# Altium project flyback.PrjPcb
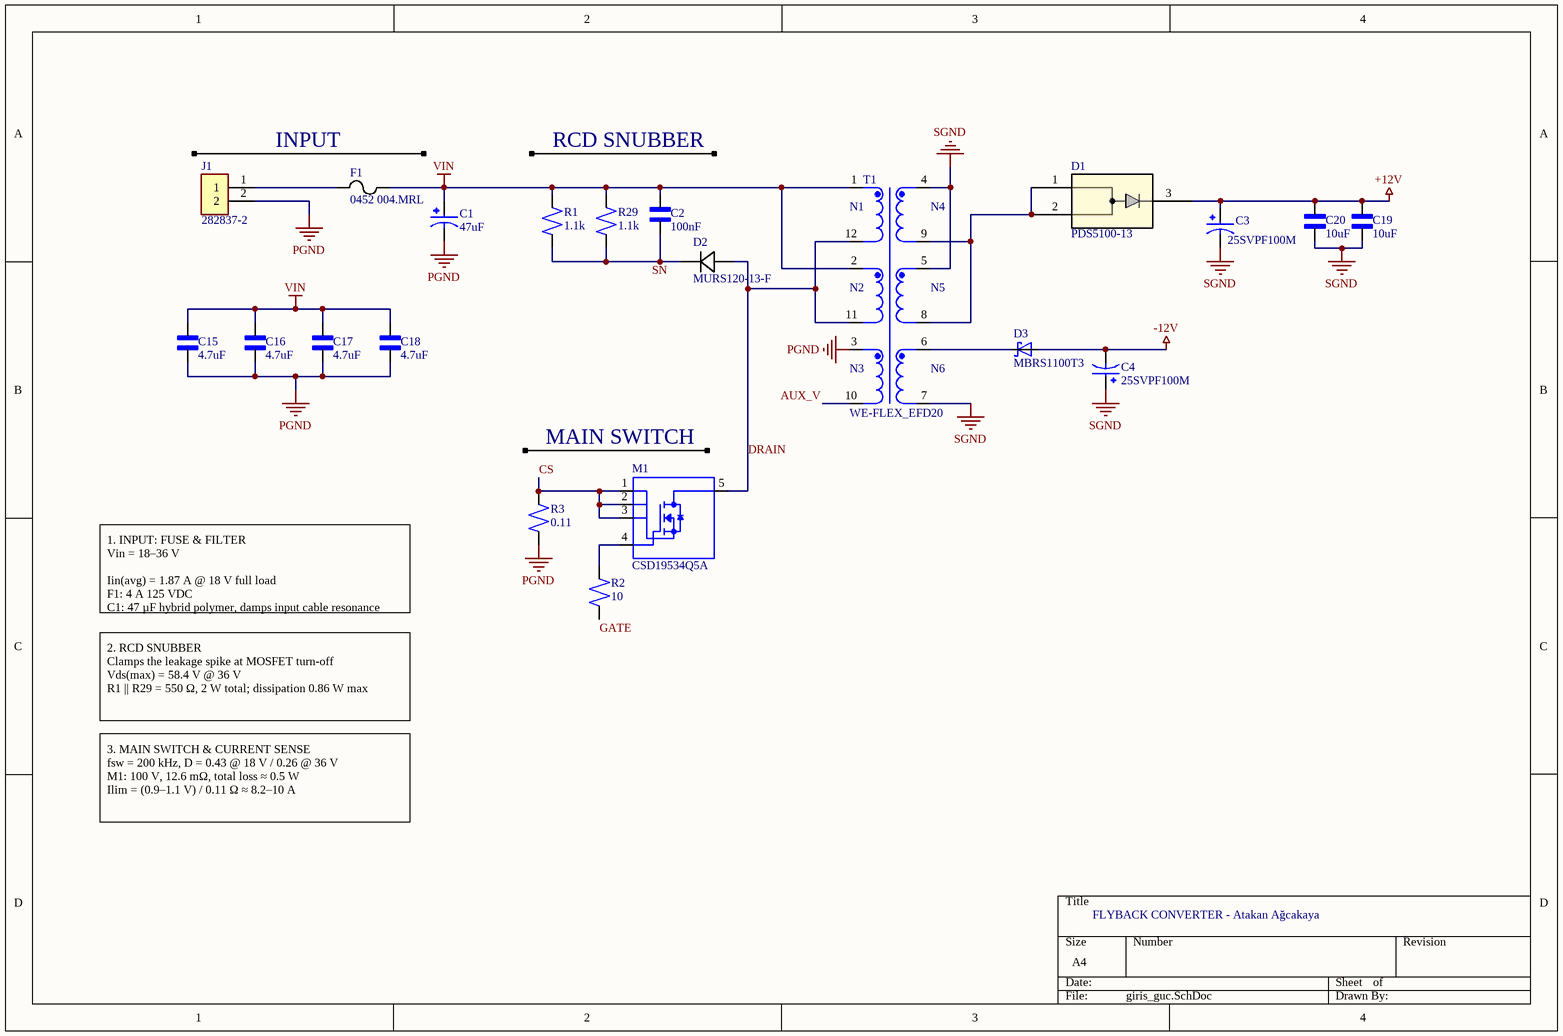
[diagram p0: giris_guc.SchDoc]
4 sheets, 98 parts. Net scope: global (net labels, ports and power ports of the same name join across sheets).
Board file: board.PcbDoc
Sheets:
  giris_guc.SchDoc
  primer_kontrol.SchDoc
  sekonder.SchDoc
  primary_koruma.SchDoc

## Sheet giris_guc.SchDoc: ATAKAN
size A4; Revision: ASD; Time: Flyback - Giris

### Parts
C1  47uF  [CAP_EEHZA1J470P]
C2  100nF  [CAPC3216X180N]
C3  25SVPF100M  [CAP_25SVPF100M]
C4  25SVPF100M  [CAP_25SVPF100M]
C15  4.7uF  [CAPC3225X280N]
C16  4.7uF  [CAPC3225X280N]
C17  4.7uF  [CAPC3225X280N]
C18  4.7uF  [CAPC3225X280N]
C19  10uF  [CAPC3225X280N]
C20  10uF  [CAPC3225X280N]
D1  PDS5100-13  [PDS5100_DIO]
D2  MURS120-13-F  [SMB_DIO]
D3  MBRS1100T3  [SMB]
F1  0452 004.MRL  [FUS_LITTELFUSE_0452_LTF]
J1  282837-2  [TE_282837-2]
M1  CSD19534Q5A  [TRANS_CSD19534Q5A]
R1  1.1k  [RESC6432X65N]
R2  10  [RESC2012X60N]
R3  0.11  [RESC6432X65N]
R29  1.1k  [RESC6432X65N]
T1  WE-FLEX_EFD20  [WE-FLEX_EFD20]

### Nets
+12V: C3.1 C19.2 C20.2 D1.3
-12V: C4.2 D3.A
PGND: C1.2 C15.1 C16.1 C17.1 C18.1 J1.2 R3.1 T1.3
SGND: C3.2 C4.1 C19.1 C20.1 T1.4 T1.5 T1.7
VIN: C1.1 C2.2 C15.2 C16.2 C17.2 C18.2 F1.2 R1.2 R29.2 T1.1 T1.2
AUX_V: T1.10
CS: M1.1(S_1) M1.2(S_2) M1.3(S_3) R3.2
DRAIN: D2.2 M1.5(D) T1.11 T1.12
GATE: R2.1
SN: C2.1 D2.1 R1.1 R29.1
NetD1_1: D1.1 D1.2 T1.8 T1.9
NetD3_C: D3.C T1.6
NetF1_1: F1.1 J1.1
NetM1_4: M1.4(G) R2.2

### Notes on the sheet
- INPUT
- RCD SNUBBER
- MAIN SWITCH
- 1. INPUT: FUSE & FILTER
  Vin = 18–36 V
  Iin(avg) = 1.87 A @ 18 V full load
  F1: 4 A 125 VDC
  C1: 47 µF hybrid polymer, damps input cable resonance
- 2. RCD SNUBBER
  Clamps the leakage spike at MOSFET turn-off
  Vds(max) = 58.4 V @ 36 V
  R1 || R29 = 550 Ω, 2 W total; dissipation 0.86 W max
- 3. MAIN SWITCH & CURRENT SENSE
  fsw = 200 kHz, D = 0.43 @ 18 V / 0.26 @ 36 V
  M1: 100 V, 12.6 mΩ, total loss ≈ 0.5 W
  Ilim = (0.9–1.1 V) / 0.11 Ω ≈ 8.2–10 A
- FLYBACK CONVERTER - Atakan Ağcakaya
- (in symbol WE-FLEX_EFD20) N1; N4; N2; N5; N3; N6

### Library data of the parts
C1 = EEHZA1J470P: EEHZA1J470P / 47F 63V Aluminum - Polymer Capacitors Radial, Can - SMD 40mOhm 10000 Hrs @ 105C; MF: Panasonic; Package: RADIAL-2 Panasonic; Price: None; Check_prices: https://www.snapeda.com/parts/EEHZA1J470P/Panasonic/view-part/?ref=eda; Value: *; SnapEDA_Link: https://www.snapeda.com/parts/EEHZA1J470P/Panasonic/view-part/?ref=snap; MP: EEHZA1J470P; Availability: In Stock; Purchase-URL: https://pricing.snapeda.com/search?q=EEHZA1J470P&ref=eda
C2 = C_1206: 100nF, 100V, X7R; Value: 100nF
C3 C4 = 25SVPF100M: CAP, ALU ELEC, POLYMER, 100UF, 25V, SMD; Capacitance: 100ÂµF; Voltage(DC): 25V; Capacitor Case / Package: Radial Can - SMD; ESR: 0.024ohm; Lifetime @ Temperature: 5000 hours; MF: Panasonic; MP: 25SVPF100M.; SnapEDA_Link: https://www.snapeda.com/parts/25SVPF100M./Panasonic/view-part/?ref=snap; Package: None; Value: *; Check_prices: https://www.snapeda.com/parts/25SVPF100M./Panasonic/view-part/?ref=eda
C15-C18 = C_1210: Murata GRM32ER72A475KE14L / 4.7µF, 100V, X7R; Value: 4.7uF
C19 C20 = C_1210: 10µF, 25V; Value: 10uF
D1 = PDS5100-13: 100V, 5A Schottky, AEC-Q101; Manufacturer_Name: Diodes Inc; Copyright: Copyright (C) 2026 Ultra Librarian. All rights reserved.; Manufacturer_Part_Number: PDS5100-13; RefDes: RefDes; Type: Type
D2 = MURS120-13-F: 200V, 1A, ultra hızl; Manufacturer_Name: Diodes Inc; Copyright: Copyright (C) 2025 Ultra Librarian. All rights reserved.; Manufacturer_Part_Number: MURS120-13-F
D3 = MBRS1100T3: 1.0 A, 100 V, Schottky Power Rectifier, Surface Mount; MANUFACTURER: ON Semiconductor; Package: SMB-2 ON Semiconductor; MPN: MBRS1100T3; DATASHEET_URL: https://www.onsemi.com/pub/Collateral/MBRS1100T3-D.PDF; Value: *; SOURCE_URL: https://www.snapeda.com/parts/MBRS1100T3/Onsemi/view-part/
F1 = 0452 003.MRL: Littelfuse 0452004.MRL; Manufacturer_Name: Littelfuse Inc; Copyright: Copyright (C) 2025 Ultra Librarian. All rights reserved.; Manufacturer_Part_Number: 0452 003.MRL
J1 = 282837-2: Terminal Block Connector Wire Receptacle 2 5.08 mm 30-16 AWG Green 13.5 A 250 V | TE Connectivity 282837-2; SnapEDA_Link: https://www.snapeda.com/parts/282837-2/TE+Connectivity+AMP+Connectors/view-part/?ref=snap; Price: None; Check_prices: https://www.snapeda.com/parts/282837-2/TE+Connectivity+AMP+Connectors/view-part/?ref=eda; Purchase-URL: https://pricing.snapeda.com/search/part/282837-2/?ref=eda; MF: TE Connectivity; MP: 282837-2; Value: *; Availability: In Stock; Package: None
M1 = CSD19534Q5A: 100V, N ch NexFET MOSFET, single SON5x6, 15.1mOhm 8-VSONP -55 to 150; MF: Texas Instruments; Mouser-Purchase-URL: https://snapeda.com/shop?store=Mouser&id=485742; Package: VSONP-8 Texas Instruments; Texas_Instruments-Purchase-URL: https://snapeda.com/shop?store=Texas+Instruments&id=485742; Value: *; Price: None; DigiKey-Purchase-URL: https://snapeda.com/shop?store=DigiKey&id=485742; MP: CSD19534Q5A; SnapEDA_Link: https://www.snapeda.com/parts/CSD19534Q5A/Texas%20Instruments/view-part/485742/?ref=snap; Availability: Good
R1 R29 = R_2512: Yageo RC2512FK-071K1L / 1.1kΩ, 1W; Value: 1.1k
R2 = R_0805: Value: 10
R3 = R_2512: Yageo PT2512FK-7W0R11L / 0.11Ω, %1, 2W, AEC-Q200; Value: 0.11
T1 = WE-FLEX_EFD20: Flexible For Configurable (For DC/DC) SMPS Transformer 500VDC Isolation Surface Mount; MF: WÃ¼rth Elektronik; MP: 749196521; SnapEDA_Link: https://www.snapeda.com/parts/749196521/W%25C3%25BCrth+Elektronik+Midcom/view-part/?ref=snap; Package: None; Value: *; Check_prices: https://www.snapeda.com/parts/749196521/W%25C3%25BCrth+Elektronik+Midcom/view-part/?ref=eda

## Sheet primer_kontrol.SchDoc
size A4
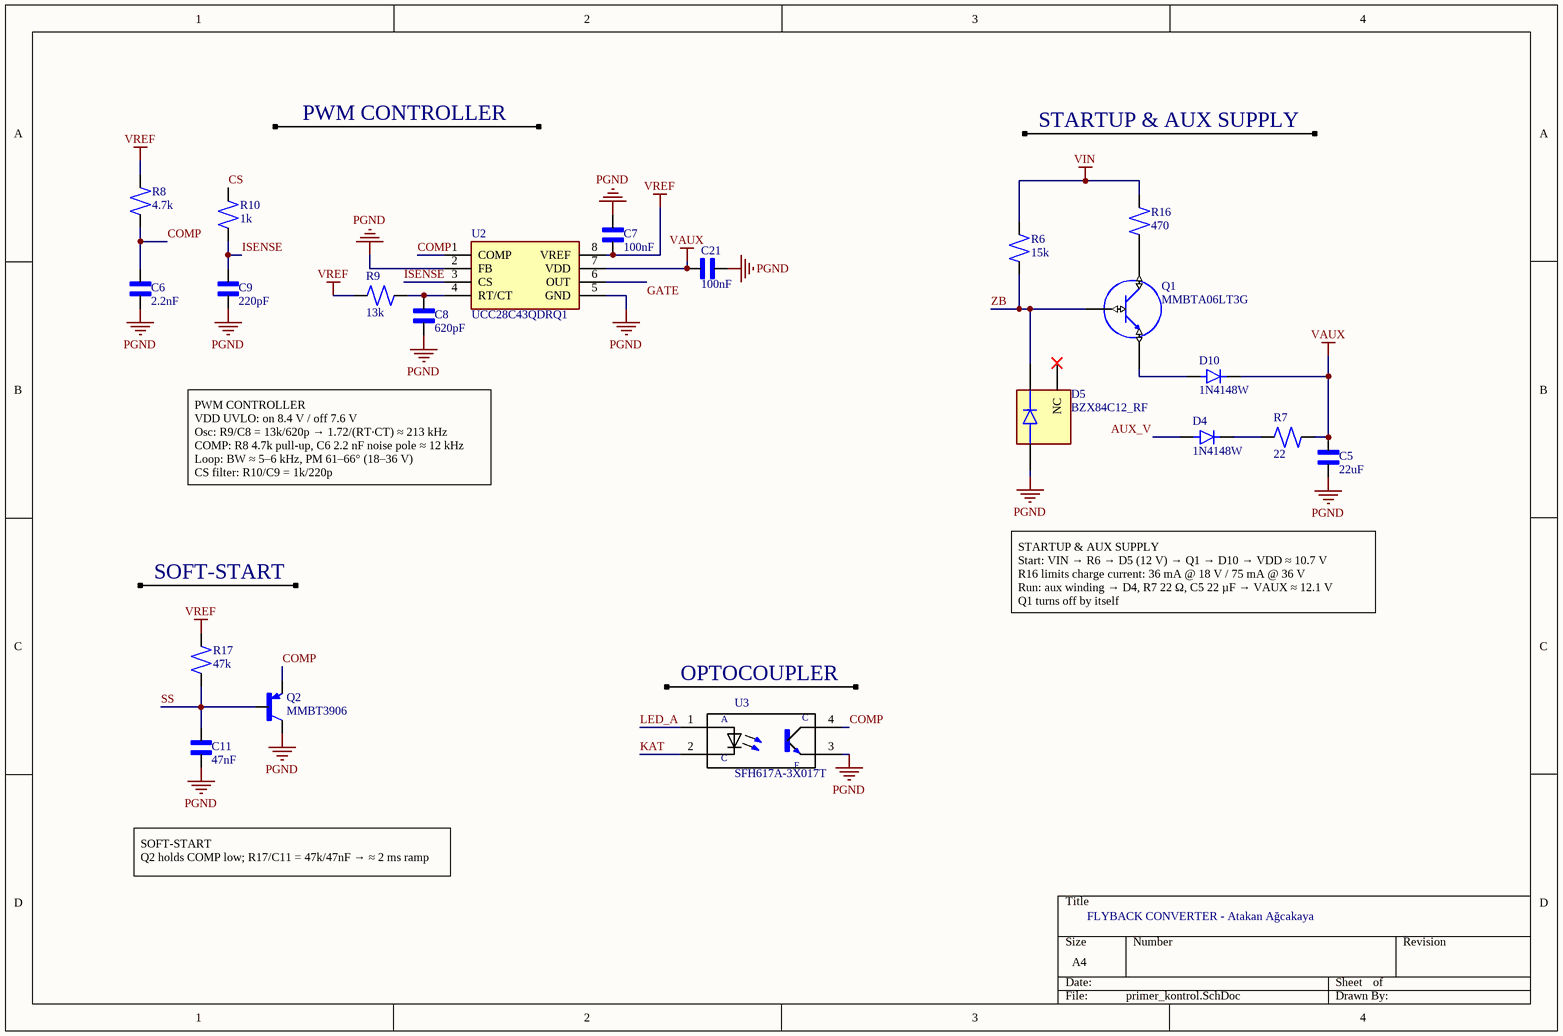
[diagram p1: primer_kontrol.SchDoc]

### Parts
C5  22uF  [CAPC3225X280N]
C6  2.2nF  [CAPC2012X145N]
C7  100nF  [CAPC2012X145N]
C8  620pF  [CAPC2012X145N]
C9  220pF  [CAPC2012X145N]
C11  47nF  [CAPC2012X145N]
C21  100nF  [CAPC2012X145N]
D4  1N4148W  [SODFL3816X120N]
D5  BZX84C12_RF  [SOT95P237X112-3N]
D10  1N4148W  [SODFL3816X120N]
Q1  MMBTA06LT3G  [SOT-23]
Q2  MMBT3906  [SOT95P260X140-3N]
R6  15k  [RESC2012X60N]
R7  22  [RESC2012X60N]
R8  4.7k  [RESC2012X60N]
R9  13k  [RESC2012X60N]
R10  1k  [RESC2012X60N]
R16  470  [RESC3216X65N]
R17  47k  [RESC2012X60N]
U2  UCC28C43QDRQ1  [SOIC127P600X175-8N]
U3  SFH617A-3X017T  [*SOIC254P1016X360-4N]

### Nets
PGND: C5.1 C6.1 C7.1 C8.1 C9.1 C11.1 C21.1 D5.1(A) Q2.3(C) U2.2(FB) U2.5(GND) U3.3(E)
VAUX: C5.2 C21.2 D10.C(K) R7.1 U2.7(VDD)
VIN: R6.2 R16.2
VREF: C7.2 R8.2 R9.2 R17.2 U2.8(VREF)
AUX_V: D4.A
COMP: C6.2 Q2.2(E) R8.1 U2.1(COMP) U3.4(CO)
CS: R10.2
GATE: U2.6(OUT)
ISENSE: C9.2 R10.1 U2.3(CS)
KAT: U3.2(C)
LED_A: U3.1(A)
SS: C11.2 Q2.1(B) R17.1
ZB: D5.3(K) Q1.BASE R6.1
NetC8_2: C8.2 R9.1 U2.4(RT/CT)
NetD4_C: D4.C(K) R7.2
NetD10_A: D10.A Q1.EMITTER
NetQ1_COLLECTOR: Q1.COLLECTOR R16.1

Not connected (* = marked no-connect by the designer): D5 2(NC)*

### Notes on the sheet
- PWM CONTROLLER
- STARTUP & AUX SUPPLY
- PWM CONTROLLER
  VDD UVLO: on 8.4 V / off 7.6 V
  Osc: R9/C8 = 13k/620p → 1.72/(RT·CT) ≈ 213 kHz
  COMP: R8 4.7k pull-up, C6 2.2 nF noise pole ≈ 12 kHz
  Loop: BW ≈ 5–6 kHz, PM 61–66° (18–36 V)
  CS filter: R10/C9 = 1k/220p
- SOFT-START
- STARTUP & AUX SUPPLY
  Start: VIN → R6 → D5 (12 V) → Q1 → D10 → VDD ≈ 10.7 V
  R16 limits charge current: 36 mA @ 18 V / 75 mA @ 36 V
  Run: aux winding → D4, R7 22 Ω, C5 22 µF → VAUX ≈ 12.1 V
  Q1 turns off by itself
- (near U3) OPTOCOUPLER
- SOFT-START
  Q2 holds COMP low; R17/C11 = 47k/47nF → ≈ 2 ms ramp
- FLYBACK CONVERTER - Atakan Ağcakaya

### Library data of the parts
C5 = C_1210: 22µF, 25V, X7R; Value: 22uF
C6-C9 C11 C21 = C_0805
  C6: Value: 2.2nF
  C7 C21: Value: 100nF
  C8: Value: 620pF
  C9: Value: 220pF
  C11: Value: 47nF
D4 D10 = 1N4148W: Small Signal Diode, SOD-123F, 100V, 0.15A, 150Â°C; MF: Diotec Semiconductor; SnapEDA_Link: https://www.snapeda.com/parts/1N4148W/Diotec/view-part/?ref=snap; Package: SOD-123F Diotec; Value: *; MP: 1N4148W; Check_prices: https://www.snapeda.com/parts/1N4148W/Diotec/view-part/?ref=eda
D5 = BZX84C12_RF: MF: {'manufacturer': u'Taiwan Semiconductor'}; MP: BZX84C12 RFG; Package: None; Price: None; Value: *; Availability: Unavailable
Q1 = MMBTA06LT3G: Bipolar (BJT) Transistor NPN 80 V 500 mA 100MHz 225 mW Surface Mount SOT-23-3 (TO-236); MF: ON Semiconductor; SnapEDA_Link: https://www.snapeda.com/parts/MMBTA06LT3G/Onsemi/view-part/?ref=snap; Package: SOT-23-3 ON Semiconductor; Value: *; MP: MMBTA06LT3G; Check_prices: https://www.snapeda.com/parts/MMBTA06LT3G/Onsemi/view-part/?ref=eda
Q2 = MMBT3906: Bipolar (BJT) Transistor PNP 40 V 200 mA 300MHz 200 mW Surface Mount SOT-23; MF: MDD; SnapEDA_Link: https://www.snapeda.com/parts/MMBT3906/MDD/view-part/?ref=snap; Package: None; Value: *; MP: MMBT3906; Check_prices: https://www.snapeda.com/parts/MMBT3906/MDD/view-part/?ref=eda
R6-R10 R17 = R_0805
  R6: Value: 15k
  R7: Value: 22
  R8: Value: 4.7k
  R9: Value: 13k
  R10: Value: 1k
  R17: Value: 47k
R16 = R_1206: Panasonic ERJ-P08J471V; Value: 470
U2 = UCC28C43QDRQ1: Automotive BiCMOS Low-Power Current-Mode PWM Controller; Manufacturer_Name: Texas Instruments; Geometry.Height: 1.75mm; Manufacturer_Part_Number: UCC28C43QDRQ1; Mouser Part Number: 595-UCC28C43QDRQ1; Mouser Price/Stock: https://www.mouser.co.uk/ProductDetail/Texas-Instruments/UCC28C43QDRQ1?qs=xhbEVWpZdWdYUtf6Fj0SHg%3D%3D; Arrow Part Number: UCC28C43QDRQ1; Arrow Price/Stock: https://www.arrow.com/en/products/ucc28c43qdrq1/texas-instruments.html?utm_currency=USD&region=nac; Datasheet Link: http://www.ti.com/lit/gpn/ucc28c43-q1
U3 = SFH617A-3X017T: MANUFACTURER: VISHAY; SOURCE_URL: https://www.snapeda.com/parts/SFH617A-3X017/Vishay/view-part/?ref=snap; Value: *

## Sheet sekonder.SchDoc
size A4
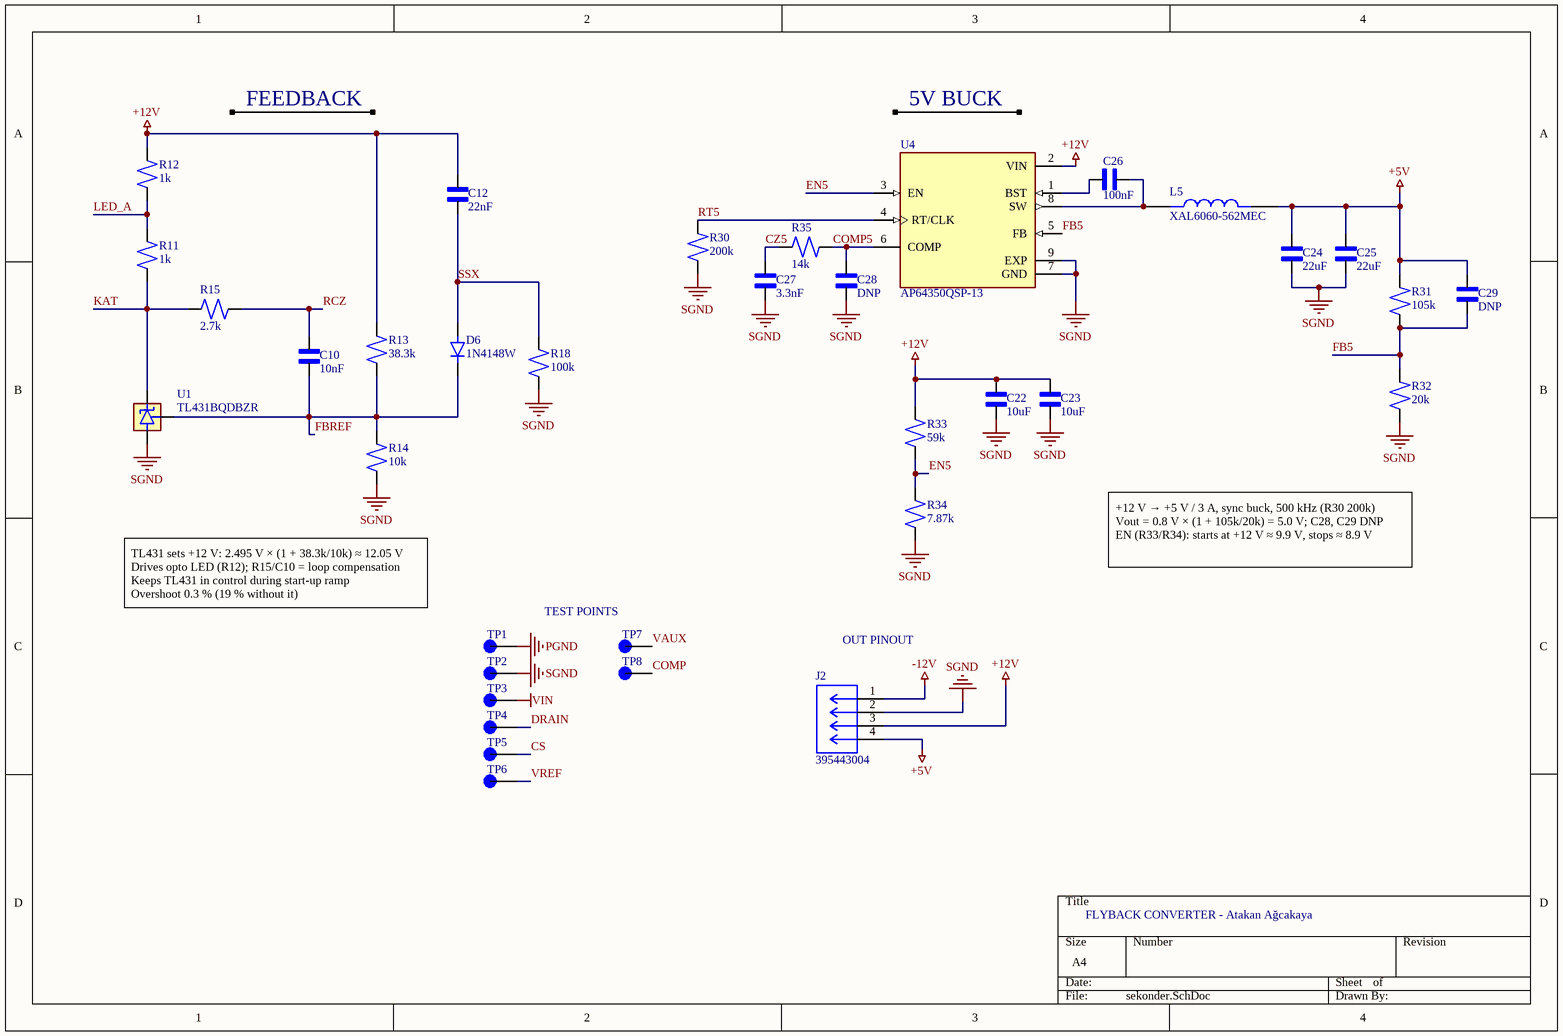
[diagram p2: sekonder.SchDoc]

### Parts
C10  10nF  [CAPC2012X145N]
C12  22nF  [CAPC2012X145N]
C22  10uF  [CAPC3225X280N]
C23  10uF  [CAPC3225X280N]
C24  22uF  [CAPC3225X280N]
C25  22uF  [CAPC3225X280N]
C26  100nF  [CAPC2012X145N]
C27  3.3nF  [CAPC2012X145N]
C28  DNP  [CAPC2012X145N]
C29  DNP  [CAPC2012X145N]
D6  1N4148W  [SODFL3816X120N]
J2  395443004  [CONN_SD-39544-001_NONE_04P_MOL]
L5  XAL6060-562MEC  [IND_XAL6060-562MEC]
R11  1k  [RESC2012X60N]
R12  1k  [RESC2012X60N]
R13  38.3k  [RESC2012X60N]
R14  10k  [RESC2012X60N]
R15  2.7k  [RESC2012X60N]
R18  100k  [RESC2012X60N]
R30  200k  [RESC2012X60N]
R31  105k  [RESC2012X60N]
R32  20k  [RESC2012X60N]
R33  59k  [RESC2012X60N]
R34  7.87k  [RESC2012X60N]
R35  14k  [RESC2012X60N]
TP1  5001  [KEYSTONE_5001]  (value not drawn)
TP2  5001  [KEYSTONE_5001]  (value not drawn)
TP3  5001  [KEYSTONE_5001]  (value not drawn)
TP4  5001  [KEYSTONE_5001]  (value not drawn)
TP5  5001  [KEYSTONE_5001]  (value not drawn)
TP6  5001  [KEYSTONE_5001]  (value not drawn)
TP7  5001  [KEYSTONE_5001]  (value not drawn)
TP8  5001  [KEYSTONE_5001]  (value not drawn)
U1  TL431BQDBZR  [SOT95P237X112-3N]
U4  AP64350QSP-13  [IC_AP64350QSP-13]

### Nets
+5V: C24.2 C25.2 C29.2 J2.4 L5.2 R31.2
+12V: C12.2 C22.2 C23.2 J2.3 R12.2 R13.2 R33.2 U4.2(VIN)
-12V: J2.1
PGND: TP1.TP
SGND: C22.1 C23.1 C24.1 C25.1 C27.1 C28.1 J2.2 R14.1 R18.1 R30.1 R32.2 R34.1 TP2.TP U1.3(ANODE) U4.7(GND) U4.9(EXP)
VAUX: TP7.TP
VIN: TP3.TP
VREF: TP6.TP
COMP: TP8.TP
COMP5: C28.2 R35.1 U4.6(COMP)
CS: TP5.TP
CZ5: C27.2 R35.2
DRAIN: TP4.TP
EN5: R33.1 R34.2 U4.3(EN)
FB5: C29.1 R31.1 R32.1 U4.5(FB)
FBREF: C10.1 D6.C(K) R13.1 R14.2 U1.2(REF)
KAT: R11.1 R15.2 U1.1(CATHODE)
LED_A: R11.2 R12.1
RCZ: C10.2 R15.1
RT5: R30.2 U4.4(RT/CLK)
SSX: C12.1 D6.A R18.2
NetC26_1: C26.1 U4.1(BST)
NetC26_2: C26.2 L5.1 U4.8(SW)

### Notes on the sheet
- FEEDBACK
- 5V BUCK
- +12 V → +5 V / 3 A, sync buck, 500 kHz (R30 200k)
  Vout = 0.8 V × (1 + 105k/20k) = 5.0 V; C28, C29 DNP
  EN (R33/R34): starts at +12 V ≈ 9.9 V, stops ≈ 8.9 V
- TL431 sets +12 V: 2.495 V × (1 + 38.3k/10k) ≈ 12.05 V
  Drives opto LED (R12); R15/C10 = loop compensation
  Keeps TL431 in control during start-up ramp
  Overshoot 0.3 % (19 % without it)
- (near TP7) TEST POINTS
- (near J2) OUT PINOUT
- FLYBACK CONVERTER - Atakan Ağcakaya

### Library data of the parts
C10 C12 C26-C29 = C_0805
  C10: Value: 10nF
  C12: Value: 22nF
  C26: Value: 100nF
  C27: Value: 3.3nF
  C28 C29: Value: DNP
C22-C25 = C_1210
  C22 C23: Value: 10uF
  C24 C25: Value: 22uF
D6 = 1N4148W: as D4 on sheet primer_kontrol; SnapEDA_Link: https://www.snapeda.com/parts/1N4148W/Diotec/view-part/?ref=snap; Package: SOD-123F Diotec; Value: *; MP: 1N4148W; Check_prices: https://www.snapeda.com/parts/1N4148W/Diotec/view-part/?ref=eda
J2 = 395443004: Conn Eurostyle Block 4 POS 5.08mm Solder ST Thru-Hole 15A/Contact Eurostyleâ„¢; MF: Molex; SnapEDA_Link: https://www.snapeda.com/parts/395443004/Molex/view-part/?ref=snap; Package: None; Value: *; MP: 395443004; Check_prices: https://www.snapeda.com/parts/395443004/Molex/view-part/?ref=eda
L5 = XAL6060-562MEC: 5.6 ÂµH Shielded Molded Inductor 10 A 15.9mOhm Max Nonstandard; MF: Coilcraft; SnapEDA_Link: https://www.snapeda.com/parts/XAL6060-562MEC/Coilcraft/view-part/?ref=snap; Package: None; Value: *; MP: XAL6060-562MEC; Check_prices: https://www.snapeda.com/parts/XAL6060-562MEC/Coilcraft/view-part/?ref=eda
R11-R15 R18 R30-R35 = R_0805
  R11 R12: Value: 1k
  R13: Value: 38.3k
  R14: Value: 10k
  R15: Value: 2.7k
  R18: Value: 100k
  R30: Value: 200k
  R31: Value: 105k
  R32: Value: 20k
  R33: Value: 59k
  R34: Value: 7.87k
  R35: Value: 14k
TP1-TP8 = 5001: MF: Keystone Electronics; Package: None; Price: None; Value: *; MP: 5001; Availability: Unavailable
U4 = AP64350QSP-13: Buck Switching Regulator IC Positive Adjustable 0.8V 1 Output 3.5A 8-SOIC (0.154, 3.90mm Width) Exposed Pad; MF: Diodes Incorporated; MP: AP64350QSP13; SnapEDA_Link: https://www.snapeda.com/parts/AP64350QSP13/Diodes+Inc./view-part/?ref=snap; Package: None; Value: *; Check_prices: https://www.snapeda.com/parts/AP64350QSP13/Diodes+Inc./view-part/?ref=eda
U1 = TL431BQDBZR: Package: None; Price: None; Value: *; MP: TL431BQDBZR; Availability: Unavailable

## Sheet primary_koruma.SchDoc
size A4
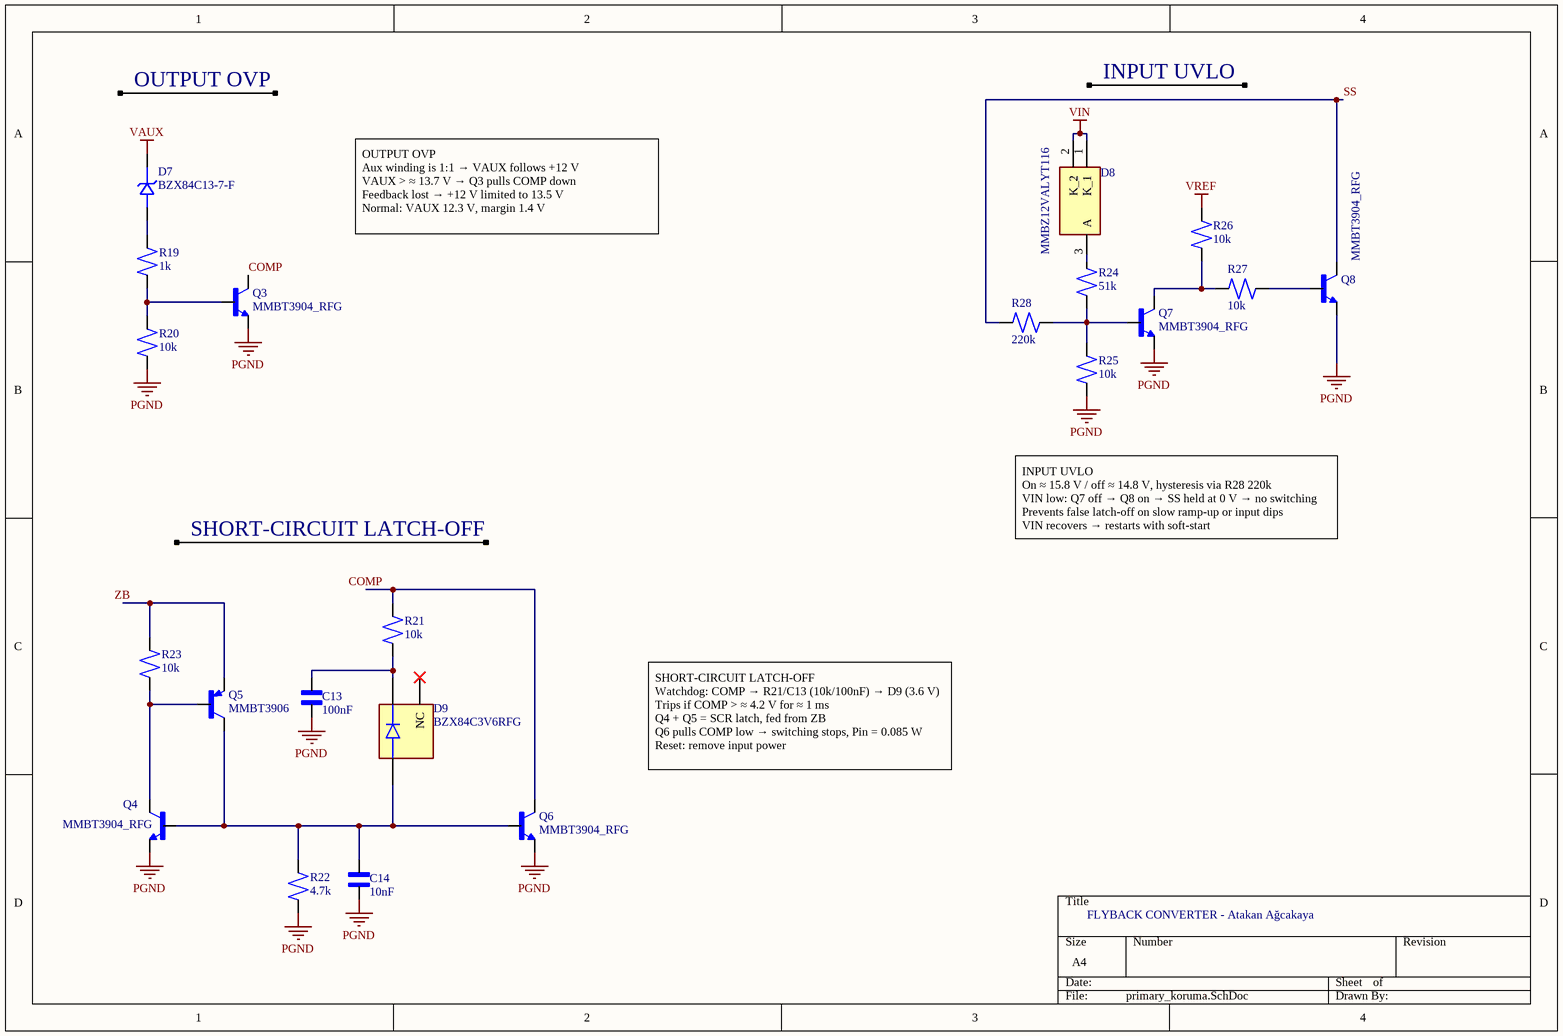
[diagram p3: primary_koruma.SchDoc]

### Parts
C13  100nF  [CAPC2012X145N]
C14  10nF  [CAPC2012X145N]
D7  BZX84C13-7-F  [SOT91P240X105-3N]
D8  MMBZ12VALYT116  [SOT95P240X115-3N]
D9  BZX84C3V6RFG  [SOT95P237X112-3N]
Q3  MMBT3904_RFG  [SOT95P237X112-3N]
Q4  MMBT3904_RFG  [SOT95P237X112-3N]
Q5  MMBT3906  [SOT95P260X140-3N]
Q6  MMBT3904_RFG  [SOT95P237X112-3N]
Q7  MMBT3904_RFG  [SOT95P237X112-3N]
Q8  MMBT3904_RFG  [SOT95P237X112-3N]
R19  1k  [RESC2012X60N]
R20  10k  [RESC2012X60N]
R21  10k  [RESC2012X60N]
R22  4.7k  [RESC2012X60N]
R23  10k  [RESC2012X60N]
R24  51k  [RESC2012X60N]
R25  10k  [RESC2012X60N]
R26  10k  [RESC2012X60N]
R27  10k  [RESC2012X60N]
R28  220k  [RESC2012X60N]

### Nets
PGND: C13.1 C14.1 Q3.2(E) Q4.2(E) Q6.2(E) Q7.2(E) Q8.2(E) R20.1 R22.1 R25.2
VAUX: D7.3(CATHODE)
VIN: D8.1(K_1) D8.2(K_2)
VREF: R26.1
COMP: Q3.3(C) Q6.3(C) R21.2
SS: Q8.3(C) R28.2
ZB: Q5.2(E) R23.2
NetC13_2: C13.2 D9.3(K) R21.1
NetC14_2: C14.2 D9.1(A) Q4.1(B) Q5.3(C) Q6.1(B) R22.2
NetD7_1: D7.1(ANODE) R19.2
NetD8_3: D8.3(A) R24.2
NetQ3_1: Q3.1(B) R19.1 R20.2
NetQ4_3: Q4.3(C) Q5.1(B) R23.1
NetQ7_1: Q7.1(B) R24.1 R25.1 R28.1
NetQ7_3: Q7.3(C) R26.2 R27.1
NetQ8_1: Q8.1(B) R27.2

Not connected (* = marked no-connect by the designer): D9 2(NC)*

### Notes on the sheet
- OUTPUT OVP
- INPUT UVLO
- OUTPUT OVP
  Aux winding is 1:1 → VAUX follows +12 V
  VAUX > ≈ 13.7 V → Q3 pulls COMP down
  Feedback lost → +12 V limited to 13.5 V
  Normal: VAUX 12.3 V, margin 1.4 V
- SHORT-CIRCUIT LATCH-OFF
- INPUT UVLO
  On ≈ 15.8 V / off ≈ 14.8 V, hysteresis via R28 220k
  VIN low: Q7 off → Q8 on → SS held at 0 V → no switching
  Prevents false latch-off on slow ramp-up or input dips
  VIN recovers → restarts with soft-start
- SHORT-CIRCUIT LATCH-OFF
  Watchdog: COMP → R21/C13 (10k/100nF) → D9 (3.6 V)
  Trips if COMP > ≈ 4.2 V for ≈ 1 ms
  Q4 + Q5 = SCR latch, fed from ZB
  Q6 pulls COMP low → switching stops, Pin = 0.085 W
  Reset: remove input power
- FLYBACK CONVERTER - Atakan Ağcakaya

### Library data of the parts
C13 C14 = C_0805
  C13: Value: 100nF
  C14: Value: 10nF
D7 = BZX84C13-7-F: Zener Diode 13 V 300 mW Â±6.54% Surface Mount SOT-23-3; MF: Diodes Inc.; SnapEDA_Link: https://www.snapeda.com/parts/BZX84C13-7-F/Diodes+Inc./view-part/?ref=snap; Package: SOT-23 Diodes Inc.; Value: *; MP: BZX84C13-7-F; Check_prices: https://www.snapeda.com/parts/BZX84C13-7-F/Diodes+Inc./view-part/?ref=eda
D8 = MMBZ12VALYT116: 8.5V, SOT-23, Dual Line, Anode Common Transient Voltage Suppressor; Manufacturer_Name: ROHM Semiconductor; Geometry.Height: 1.15mm; Manufacturer_Part_Number: MMBZ12VALYT116; Mouser Part Number: 755-MMBZ12VALYT116; Mouser Price/Stock: https://www.mouser.co.uk/ProductDetail/ROHM-Semiconductor/MMBZ12VALYT116?qs=QNEnbhJQKvYQxyBM5QcKxw%3D%3D; Arrow Part Number: *; Arrow Price/Stock: *; Datasheet Link: https://fscdn.rohm.com/en/products/databook/datasheet/discrete/diode/zener/mmbz12valyt116-e.pdf
D9 = BZX84C3V6RFG: Diode Zener Single 3.6V 5% 0.3W 3-Pin SOT-23 Plastic T/R; MF: Taiwan Semiconductor; SnapEDA_Link: https://www.snapeda.com/parts/BZX84C3V6RFG/taiwan/view-part/?ref=snap; Package: SOT-23 Taiwan Semiconductor; Value: *; MP: BZX84C3V6RFG; Check_prices: https://www.snapeda.com/parts/BZX84C3V6RFG/taiwan/view-part/?ref=eda
Q3 Q4 Q6-Q8 = MMBT3904_RFG: SOT-23, 60V, 0.2A, NPN Transistor; MF: Taiwan Semiconductor; MP: MMBT3904 RFG; SnapEDA_Link: https://www.snapeda.com/parts/MMBT3904%20RFG/taiwan/view-part/?ref=snap; Package: SOT-23-3 Taiwan Semiconductor; Value: *; Check_prices: https://www.snapeda.com/parts/MMBT3904%20RFG/taiwan/view-part/?ref=eda
Q5 = MMBT3906: as Q2 on sheet primer_kontrol; SnapEDA_Link: https://www.snapeda.com/parts/MMBT3906/MDD/view-part/?ref=snap; Package: None; Value: *; MP: MMBT3906; Check_prices: https://www.snapeda.com/parts/MMBT3906/MDD/view-part/?ref=eda
R19-R28 = R_0805
  R19: Value: 1k
  R20 R21 R23 R25-R27: Value: 10k
  R22: Value: 4.7k
  R24: Value: 51k
  R28: Value: 220k

## Nets that join several sheets
+12V: giris_guc (C3.1 C19.2 C20.2 D1.3), sekonder (8 pins)
-12V: giris_guc (C4.2 D3.A), sekonder (J2.1)
PGND: giris_guc (8 pins), primer_kontrol (12 pins), sekonder (TP1.TP), primary_koruma (10 pins)
SGND: giris_guc (7 pins), sekonder (16 pins)
VAUX: primer_kontrol (5 pins), sekonder (TP7.TP), primary_koruma (D7.3)
VIN: giris_guc (11 pins), primer_kontrol (R6.2 R16.2), sekonder (TP3.TP), primary_koruma (D8.1 D8.2)
VREF: primer_kontrol (5 pins), sekonder (TP6.TP), primary_koruma (R26.1)
AUX_V: giris_guc (T1.10), primer_kontrol (D4.A)
COMP: primer_kontrol (5 pins), sekonder (TP8.TP), primary_koruma (Q3.3 Q6.3 R21.2)
CS: giris_guc (M1.1 M1.2 M1.3 R3.2), primer_kontrol (R10.2), sekonder (TP5.TP)
DRAIN: giris_guc (D2.2 M1.5 T1.11 T1.12), sekonder (TP4.TP)
GATE: giris_guc (R2.1), primer_kontrol (U2.6)
KAT: primer_kontrol (U3.2), sekonder (R11.1 R15.2 U1.1)
LED_A: primer_kontrol (U3.1), sekonder (R11.2 R12.1)
SS: primer_kontrol (C11.2 Q2.1 R17.1), primary_koruma (Q8.3 R28.2)
ZB: primer_kontrol (D5.3 Q1.BASE R6.1), primary_koruma (Q5.2 R23.2)